# Altium project Esquematicos_Kraken.PrjPcb
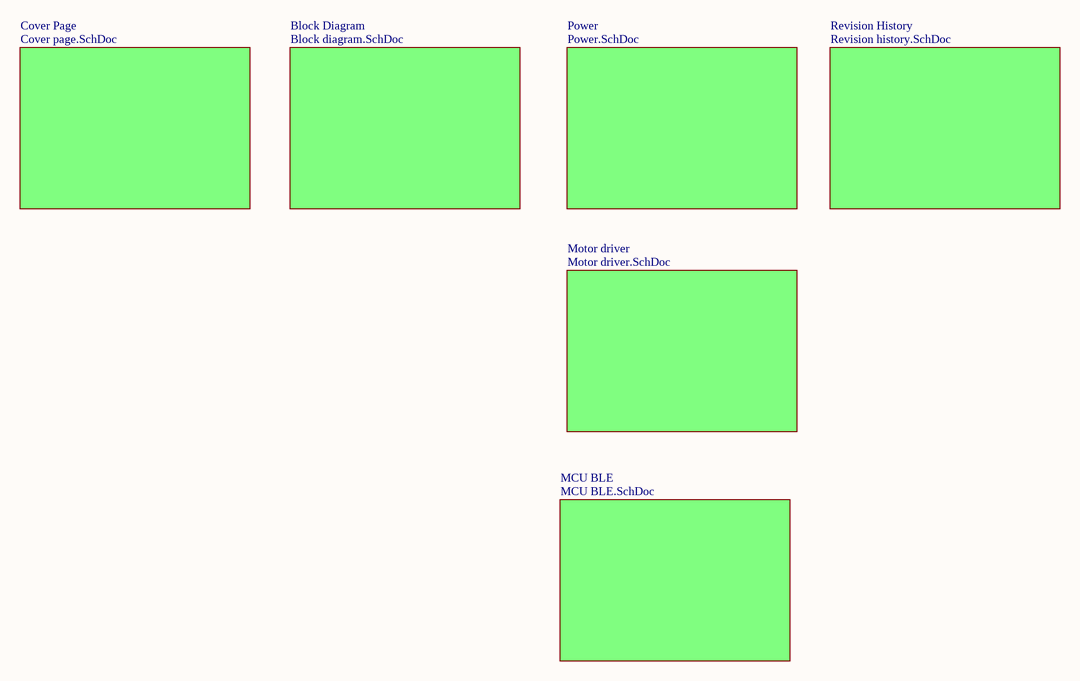
[diagram p0: Kraken.SchDoc]
Author: Jose Martinez; Carne: 24050; Curso: PCB; Revision: v1.0
7 sheets, 13 parts. Net scope: flat (ports and power ports of the same name join across sheets).
Board file: PCBKraken.PcbDoc
Sheets:
  Kraken.SchDoc
    Cover Page = Cover page.SchDoc
    Block Diagram = Block diagram.SchDoc
    Revision History = Revision history.SchDoc
    Power = Power.SchDoc
    Motor driver = Motor driver.SchDoc
    MCU BLE = MCU BLE.SchDoc

## Sheet Kraken.SchDoc
size Letter; SheetNumber: 7; SheetTotal: 7

### Sub-sheets
Block Diagram = Block diagram.SchDoc: no entries
Cover Page = Cover page.SchDoc: no entries
MCU BLE = MCU BLE.SchDoc: no entries
Motor driver = Motor driver.SchDoc: no entries
Power = Power.SchDoc: no entries
Revision History = Revision history.SchDoc: no entries

### Notes on the sheet
- Proyecto:
- Autor:
- Carné:
- Documento:
- Curso:
- Revision:
- Fecha:
- Tamaño:
- Carta
- Hoja:      de

## Sheet Cover page.SchDoc
size Letter; SheetNumber: 1; SheetTotal: 7
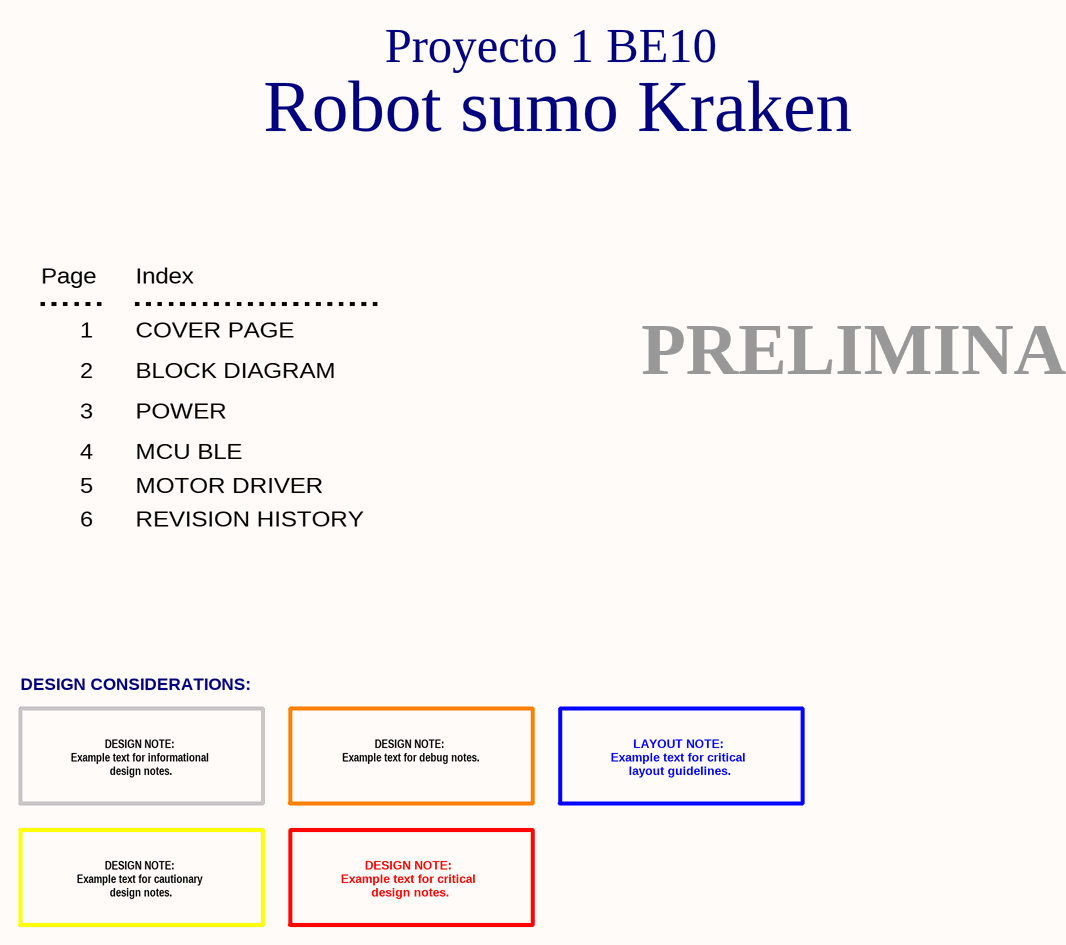
[diagram p1: Cover page.SchDoc]

### Notes on the sheet
- Proyecto 1 BE10
- Robot sumo Kraken
- Page
- Index
- 1
- COVER PAGE
- 2
- 3
- BLOCK DIAGRAM
- POWER
- PRELIMINAR
- 4
- 5
- MCU BLE
- MOTOR DRIVER
- 6
- REVISION HISTORY
- DESIGN CONSIDERATIONS:
- DESIGN NOTE:
  Example text for informational
  design notes.
- DESIGN NOTE:
  Example text for debug notes.
- LAYOUT NOTE:
  Example text for critical
  layout guidelines.
- DESIGN NOTE:
  Example text for cautionary
  design notes.
- DESIGN NOTE:
  Example text for critical
  design notes.
- Proyecto:
- Autor:
- Carné:
- Documento:
- Curso:
- Revision:
- Fecha:
- Tamaño:
- Carta
- Hoja:      de

## Sheet Block diagram.SchDoc
size Letter; SheetNumber: 2; SheetTotal: 7
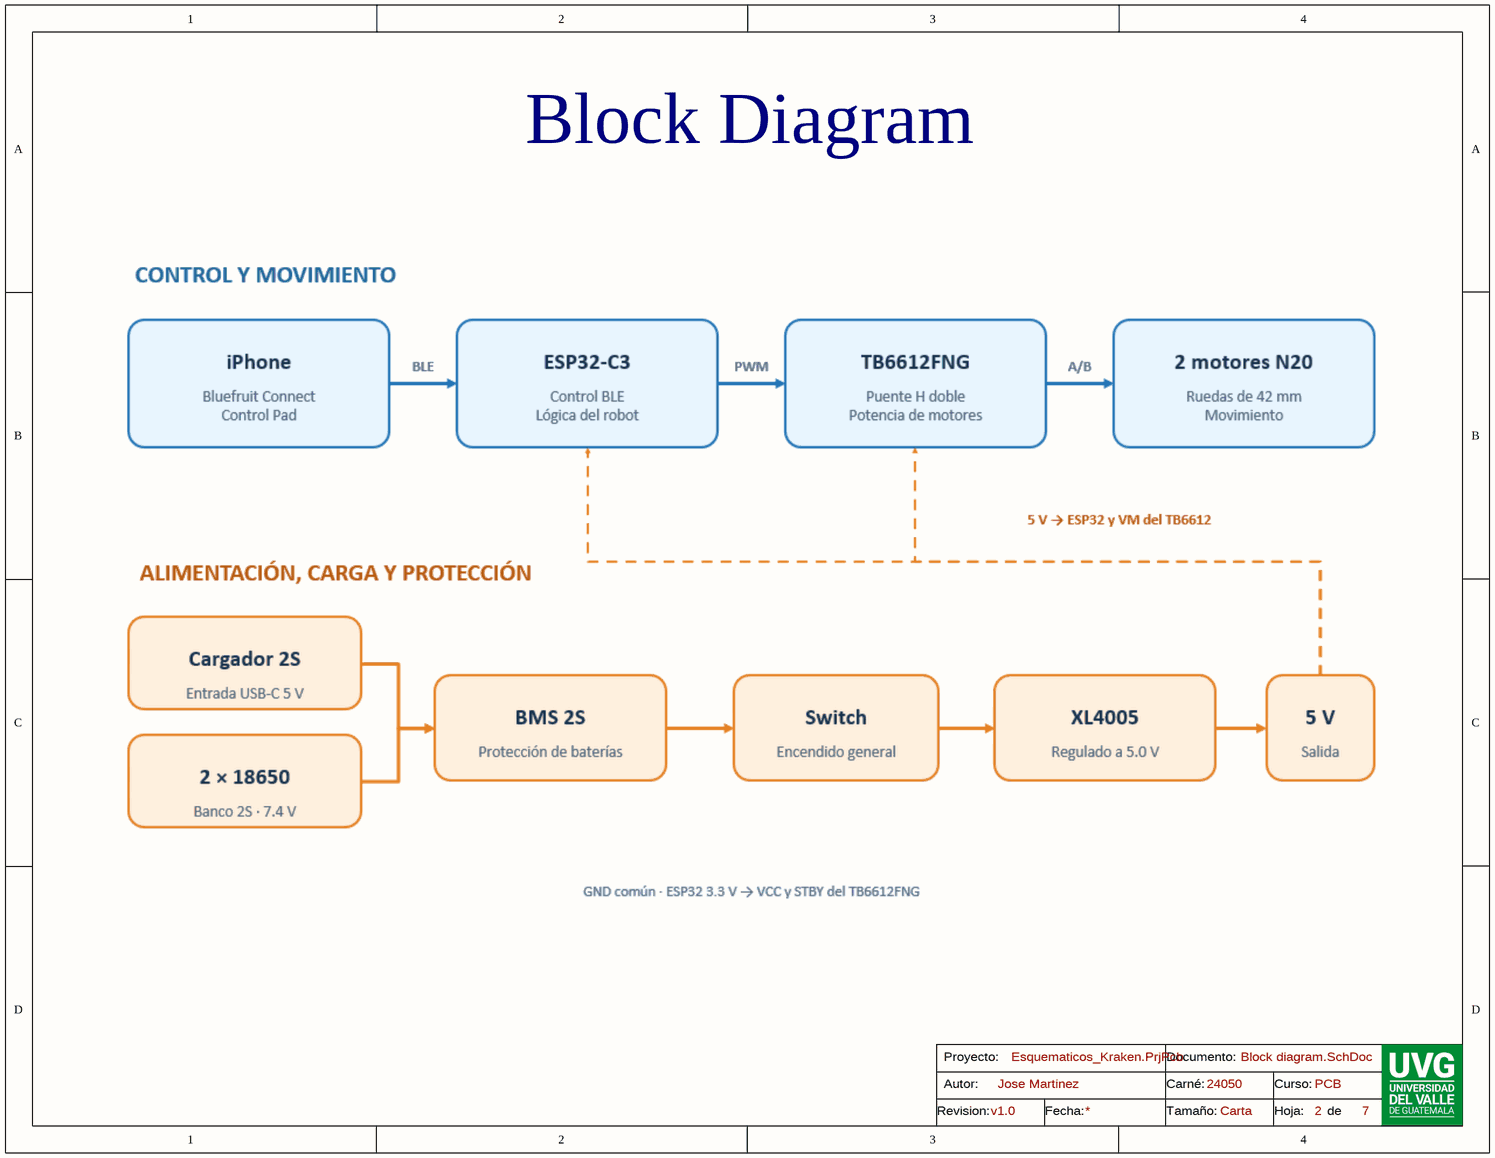
[diagram p2: Block diagram.SchDoc]

### Notes on the sheet
- Block Diagram
- Proyecto:
- Autor:
- Carné:
- Documento:
- Curso:
- Revision:
- Fecha:
- Tamaño:
- Carta
- Hoja:      de

## Sheet Revision history.SchDoc
size Letter; SheetNumber: 6; SheetTotal: 7
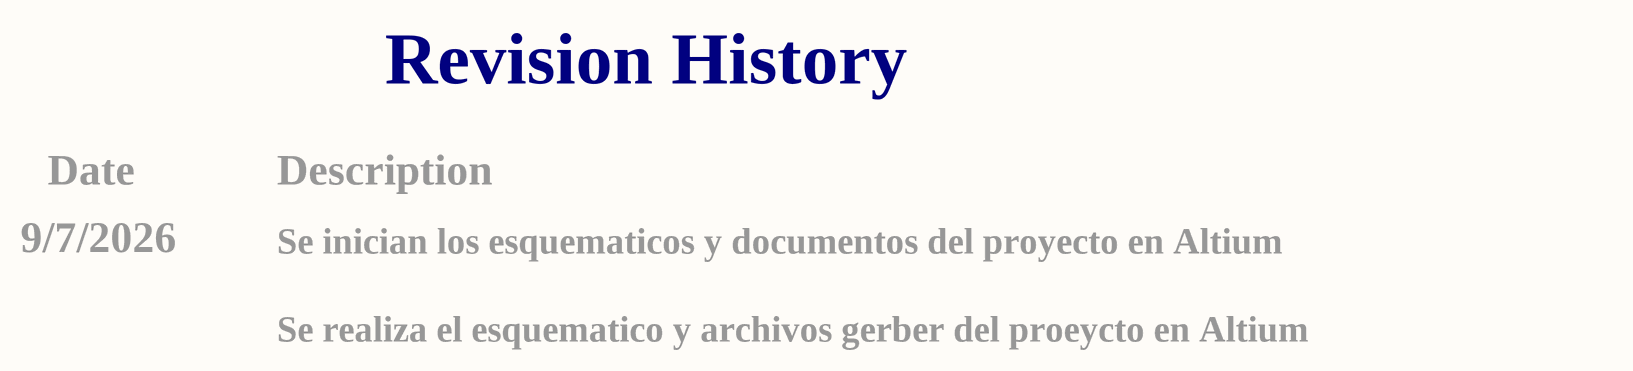
[diagram p3: Revision history.SchDoc]

### Notes on the sheet
- Revision History
- Date
- Description
- 9/7/2026
- Se inician los esquematicos y documentos del proyecto en Altium
- Se realiza el esquematico y archivos gerber del proeycto en Altium
- Proyecto:
- Autor:
- Carné:
- Documento:
- Curso:
- Revision:
- Fecha:
- Tamaño:
- Carta
- Hoja:      de

## Sheet Power.SchDoc
size Letter; SheetNumber: 3; SheetTotal: 7
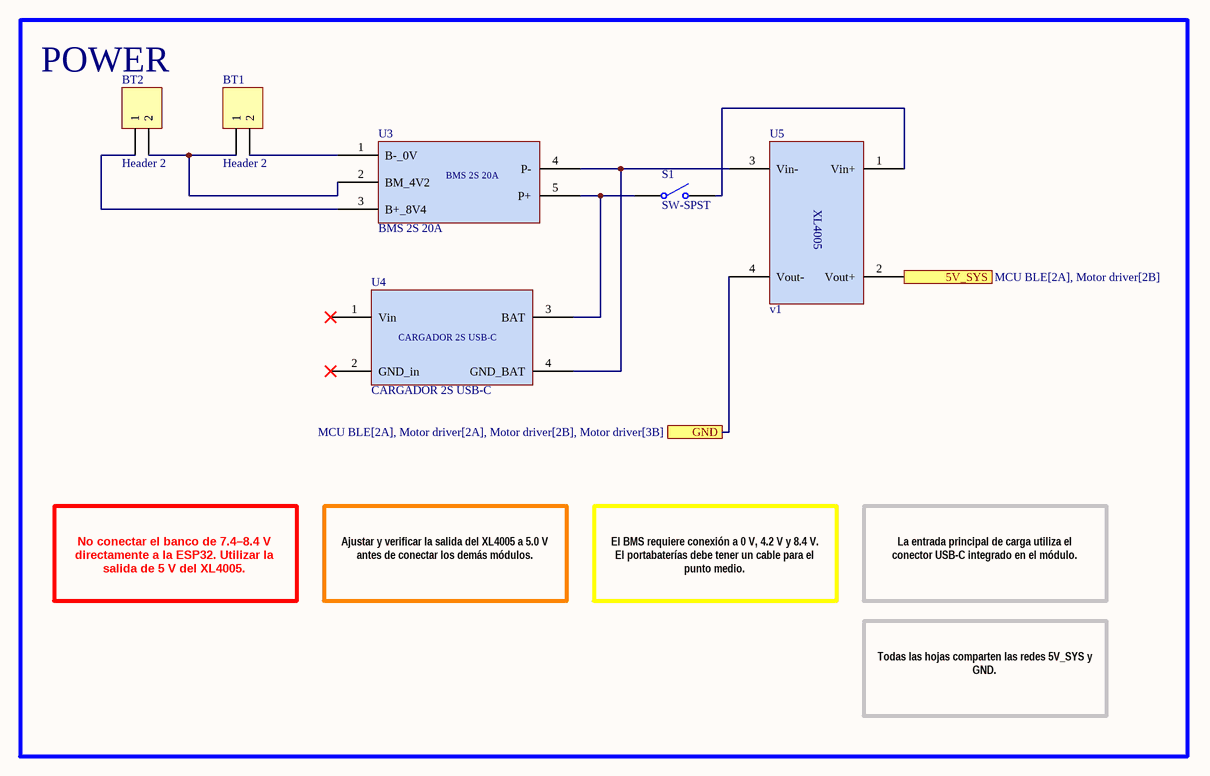
[diagram p4: Power.SchDoc]

### Parts
BT1  Header 2  [BORNERAS]
BT2  Header 2  [BORNERAS]
S1  SW-SPST  [BORNERAS]
U3  BMS 2S 20A  [BMS_2S_20A_HW391]
U4  CARGADOR 2S USB-C  [CARGADOR_2S_USBC]
U5  v1  [XL4005_MODULE]

### Blocks framed on the sheet
POWER: BT1 BT2 S1 U3-U5

### Ports
5V_SYS (see MCU BLE[2A], Motor driver[2B]), GND (see MCU BLE[2A], Motor driver[2A], Motor driver[2B], Motor driver[3B])

### Nets
NetBT1_1: BT1.1 BT2.2 U3.2(BM_4V2)
NetBT1_2: BT1.2 U3.1(B-_0V)
NetBT2_1: BT2.1 U3.3(B+_8V4)
NetC1_1: U5.2(Vout+) ; port 5V_SYS
NetC1_2: U5.4(Vout-) ; port GND
NetS1_1: S1.1(COMMON) U3.5(P+) U4.3(BAT)
NetS1_2: S1.2(NO) U5.1(Vin+)
NetU3_4: U3.4(P-) U4.4(GND_BAT) U5.3(Vin-)

Not connected (* = marked no-connect by the designer): U4 1(Vin)* 2(GND_in)*

### Notes on the sheet
- No conectar el banco de 7.4–8.4 V directamente a la ESP32. Utilizar la salida de 5 V del XL4005.
- Ajustar y verificar la salida del XL4005 a 5.0 V antes de conectar los demás módulos.
- El BMS requiere conexión a 0 V, 4.2 V y 8.4 V. El portabaterías debe tener un cable para el punto medio.
- La entrada principal de carga utiliza el conector USB-C integrado en el módulo.
- Todas las hojas comparten las redes 5V_SYS y GND.
- Proyecto:
- Autor:
- Carné:
- Documento:
- Curso:
- Revision:
- Fecha:
- Tamaño:
- Carta
- Hoja:      de
- (in symbol XL4005_MODULE) XL4005

### Library data of the parts
BT1 BT2 = Header 2: Header, 2-Pin; LatestRevisionDate: 17-Jul-2002; LatestRevisionNote: Re-released for DXP Platform.; Publisher: Altium Limited
S1 = SW-SPST: Single-Pole, Single-Throw Switch; Published: 24-Mar-1999; LatestRevisionDate: 17-Jul-2002; LatestRevisionNote: Re-released for DXP Platform.; PackageReference: SPST-2; Publisher: Altium Limited; PackageDescription: Switch; 2 Leads
U3 = BMS 2S 20A: BMS 2S 20A  v1.0
U4 = CARGADOR 2S USB-C: CARGADOR 2S USB-C v1.0
U5 = XL4005_MODULE

## Sheet Motor driver.SchDoc
size Letter; SheetNumber: 5; SheetTotal: 7
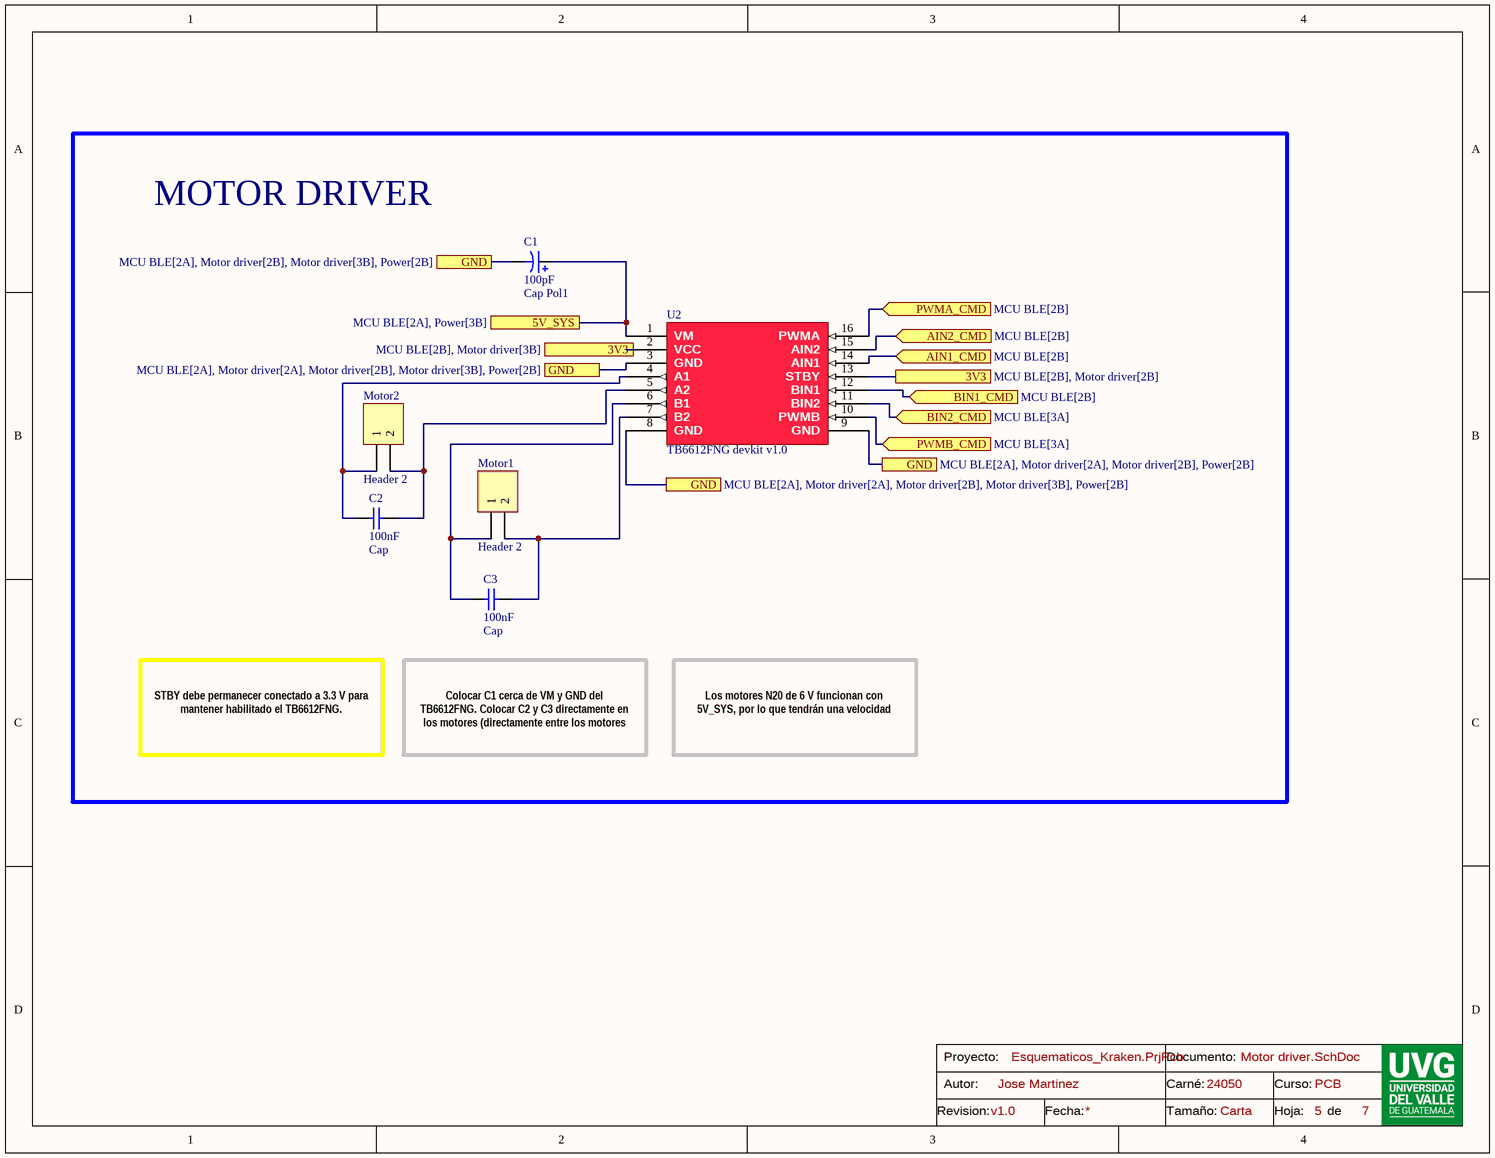
[diagram p5: Motor driver.SchDoc]

### Parts
C1  Cap Pol1  value 100pF  [CAPACITOR1000UF]
C2  Cap  value 100nF  (graphical)
C3  Cap  value 100nF  [RAD-0.3]  (graphical)
Motor1  Header 2  [BORNERAS]
Motor2  Header 2  [BORNERAS]
U2  TB6612FNG devkit v1.0  [TB6612FNG]

### Blocks framed on the sheet
MOTOR DRIVER: C1-C3 Motor1 Motor2 U2

### Ports
3V3 (see MCU BLE[2B], Motor driver[2B]), 3V3 (see MCU BLE[2B], Motor driver[3B]), 5V_SYS (see MCU BLE[2A], Power[3B]), AIN1_CMD (in, see MCU BLE[2B]), AIN2_CMD (in, see MCU BLE[2B]), BIN1_CMD (in, see MCU BLE[2B]), BIN2_CMD (in, see MCU BLE[3A]), GND (see MCU BLE[2A], Motor driver[2A], Motor driver[2B], Motor driver[3B], Power[2B]), GND (see MCU BLE[2A], Motor driver[2A], Motor driver[2B], Power[2B]), GND (see MCU BLE[2A], Motor driver[2B], Motor driver[3B], Power[2B]), PWMA_CMD (in, see MCU BLE[2B]), PWMB_CMD (in, see MCU BLE[3A])

### Nets
NetC1_1: C1.1 U2.1(VM) ; port 5V_SYS
NetC1_2: C1.2 U2.3(GND) U2.8(GND) U2.9(GND) ; port GND
NetC2_1: C2.1 Motor2.1 U2.4(A1)
NetC2_2: C2.2 Motor2.2 U2.5(A2)
NetC3_1: C3.1 Motor1.1 U2.6(B1)
NetC3_2: C3.2 Motor1.2 U2.7(B2)
NetU1_3: U2.2(VCC) U2.13(STBY) ; port 3V3
NetU1_4: U2.12(BIN1) ; port BIN1_CMD
NetU1_5: U2.16(PWMA) ; port PWMA_CMD
NetU1_7: U2.15(AIN2) ; port AIN2_CMD
NetU1_8: U2.14(AIN1) ; port AIN1_CMD
NetU1_15: U2.10(PWMB) ; port PWMB_CMD
NetU1_16: U2.11(BIN2) ; port BIN2_CMD

### Notes on the sheet
- STBY debe permanecer conectado a 3.3 V para mantener habilitado el TB6612FNG.
- Colocar C1 cerca de VM y GND del TB6612FNG. Colocar C2 y C3 directamente en los motores (directamente entre los motores fuera del pcb para reducir ruido).
- Los motores N20 de 6 V funcionan con 5V_SYS, por lo que tendrán una velocidad ligeramente menor.
- Proyecto:
- Autor:
- Carné:
- Documento:
- Curso:
- Revision:
- Fecha:
- Tamaño:
- Carta
- Hoja:      de

### Library data of the parts
C1 = Cap Pol1: Polarized Capacitor (Radial); Published: 8-Jun-2000; LatestRevisionDate: 17-Jul-2002; LatestRevisionNote: Re-released for DXP Platform.; PackageReference: RB7.6-15; Publisher: Altium Limited; PackageDescription: Polarized Capacitor (Radial); 2 Leads
C2 C3 = Cap: Capacitor; Published: 8-Jun-2000; LatestRevisionDate: 17-Jul-2002; LatestRevisionNote: Re-released for DXP Platform.; PackageReference: RAD-0.3; Publisher: Altium Limited; PackageDescription: Radial Cap, Thru-Hole; 2 Leads; 0.3 in Pin Spacing
Motor1 Motor2 = Header 2: Header, 2-Pin; LatestRevisionDate: 17-Jul-2002; LatestRevisionNote: Re-released for DXP Platform.; Publisher: Altium Limited
U2 = TB6612FNG devkit v1.0: Manufacturer: Toshiba

## Sheet MCU BLE.SchDoc
size Letter; SheetNumber: 4; SheetTotal: 7
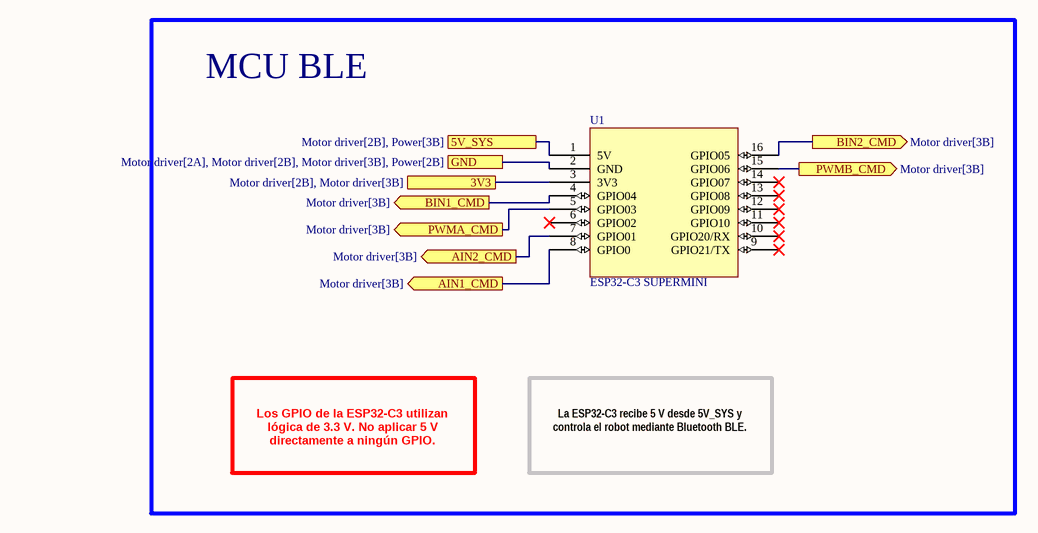
[diagram p6: MCU BLE.SchDoc]

### Parts
U1  ESP32-C3 SUPERMINI  [ESP32C3SUPERMINI]

### Blocks framed on the sheet
MCU BLE: U1

### Ports
3V3 (see Motor driver[2B], Motor driver[3B]), 5V_SYS (see Motor driver[2B], Power[3B]), AIN1_CMD (out, see Motor driver[3B]), AIN2_CMD (out, see Motor driver[3B]), BIN1_CMD (out, see Motor driver[3B]), BIN2_CMD (out, see Motor driver[3B]), GND (see Motor driver[2A], Motor driver[2B], Motor driver[3B], Power[2B]), PWMA_CMD (out, see Motor driver[3B]), PWMB_CMD (out, see Motor driver[3B])

### Nets
NetC1_1: U1.1(5V) ; port 5V_SYS
NetC1_2: U1.2(GND) ; port GND
NetU1_3: U1.3(3V3) ; port 3V3
NetU1_4: U1.4(GPIO04) ; port BIN1_CMD
NetU1_5: U1.5(GPIO03) ; port PWMA_CMD
NetU1_7: U1.7(GPIO01) ; port AIN2_CMD
NetU1_8: U1.8(GPIO0) ; port AIN1_CMD
NetU1_15: U1.15(GPIO06) ; port PWMB_CMD
NetU1_16: U1.16(GPIO05) ; port BIN2_CMD

Not connected (* = marked no-connect by the designer): U1 6(GPIO02)* 9(GPIO21/TX)* 10(GPIO20/RX)* 11(GPIO10)* 12(GPIO09)* 13(GPIO08)* 14(GPIO07)*

### Notes on the sheet
- Los GPIO de la ESP32-C3 utilizan lógica de 3.3 V. No aplicar 5 V directamente a ningún GPIO.
- La ESP32-C3 recibe 5 V desde 5V_SYS y controla el robot mediante Bluetooth BLE.
- Proyecto:
- Autor:
- Carné:
- Documento:
- Curso:
- Revision:
- Fecha:
- Tamaño:
- Carta
- Hoja:      de

### Library data of the parts
U1 = ESP32-C3 SUPERMINI: ESP32-C3 SUPERMINI V1.0

## Nets that join several sheets
NetC1_1: Power (U5.2), Motor driver (C1.1 U2.1), MCU BLE (U1.1)
NetC1_2: Power (U5.4), Motor driver (C1.2 U2.3 U2.8 U2.9), MCU BLE (U1.2)
NetU1_3: Motor driver (U2.2 U2.13), MCU BLE (U1.3)
NetU1_4: Motor driver (U2.12), MCU BLE (U1.4)
NetU1_5: Motor driver (U2.16), MCU BLE (U1.5)
NetU1_7: Motor driver (U2.15), MCU BLE (U1.7)
NetU1_8: Motor driver (U2.14), MCU BLE (U1.8)
NetU1_15: Motor driver (U2.10), MCU BLE (U1.15)
NetU1_16: Motor driver (U2.11), MCU BLE (U1.16)